# EasyEDA Pro project MSPM0G3507.eprj

# Schematic Schematic1
Board Name: Board1; Create Date: 2025-05-01
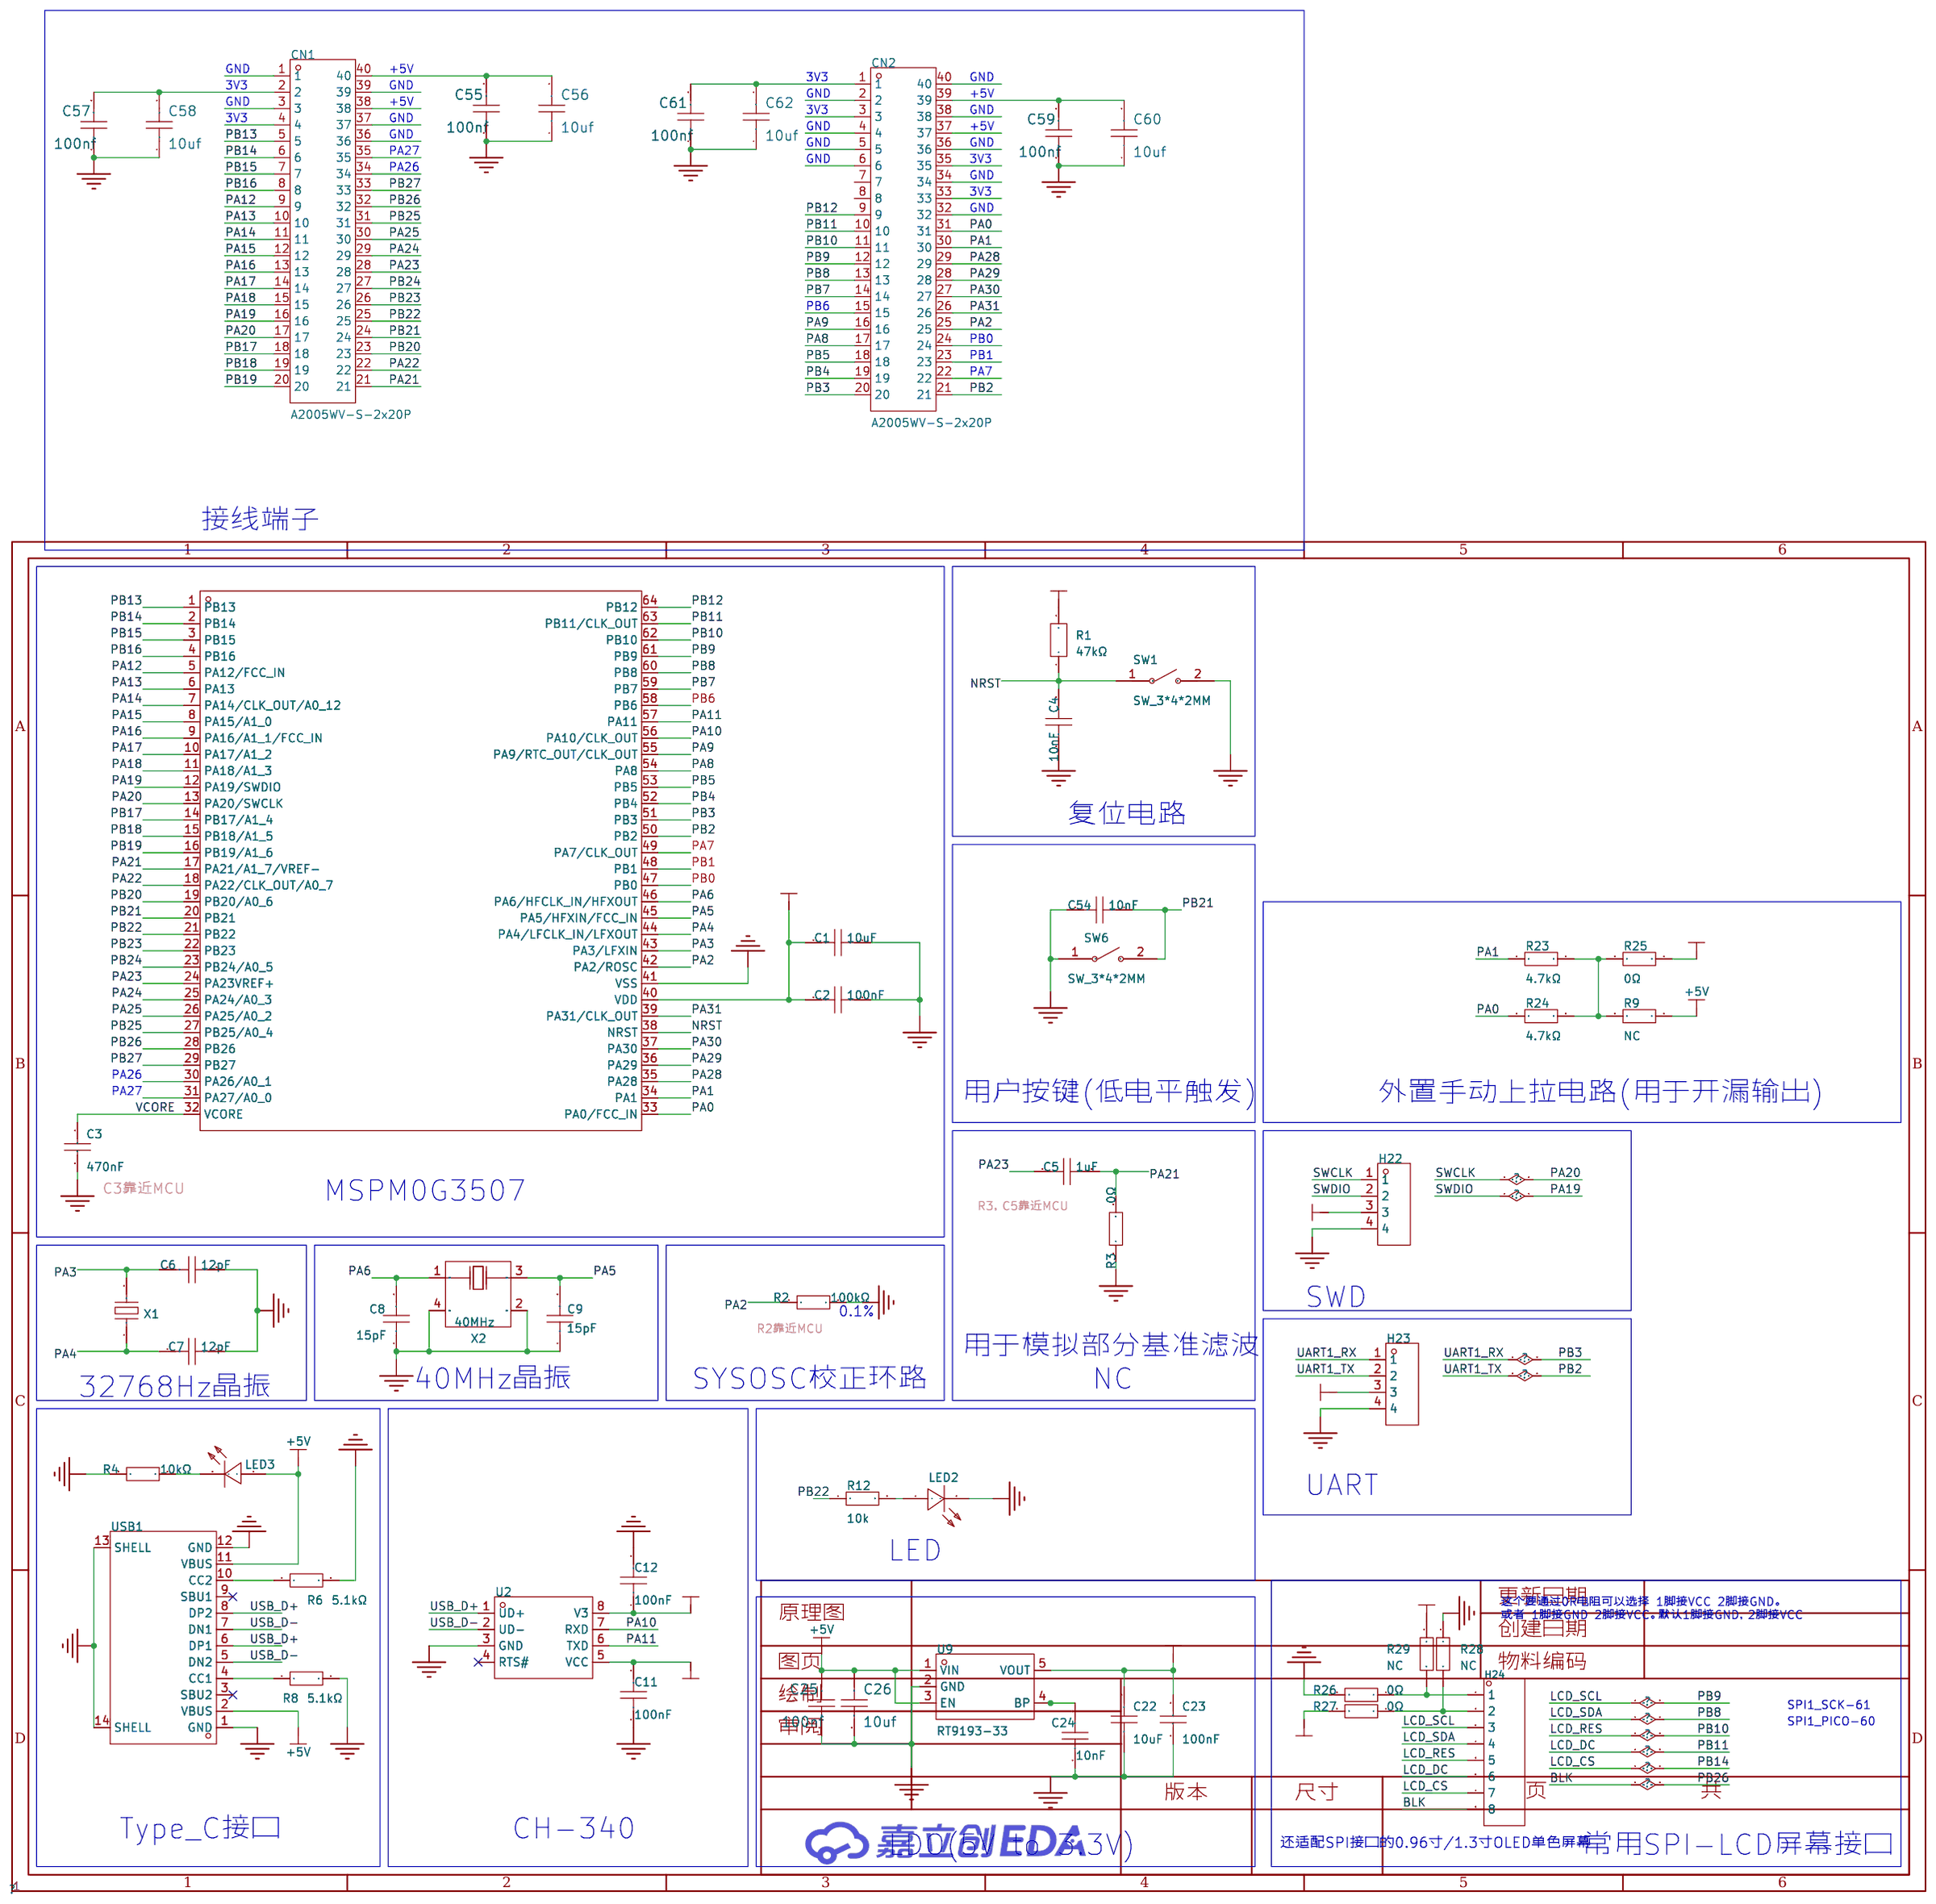
[diagram p0: schematic sheet]

## Parts
C1  10uF  [C0603]
C2  100nF  [C0603]
C3  470nF  [C0603]
C4  10nF  [C0603]
C5  1uF  [C0603]
C6  12pF  [C0603]
C7  12pF  [C0603]
C8  15pF  [C0603]
C9  15pF  [C0603]
C11  100nF  [C0603]
C12  100nF  [C0603]
C22  10uF  [C0603]
C23  100nF  [C0603]
C24  10nF  [C0603]
C25  100nf  [C0603]
C26  10uf  [C0603]
C54  10nF  [C0603]
C55  100nf  [C0603]
C56  10uf  [C0603]
C57  100nf  [C0603]
C58  10uf  [C0603]
C59  100nf  [C0603]
C60  10uf  [C0603]
C61  100nf  [C0603]
C62  10uf  [C0603]
CN1  A2005WV-S-2x20P  [HDR-TH_40P-P2.54-V-M-R2-C20-S2.54]
CN2  A2005WV-S-2x20P  [HDR-TH_40P-P2.54-V-M-R2-C20-S2.54]
H22  -  [hdr-th_4p-p2.54-v-f]
H23  -  [hdr-th_4p-p2.54-v-f]
H24  -  [HDR-TH_8P-P2.54-V-M]
LED2  NCD0805R1  [LED0603-R-RD]
LED3  NCD0805R1  [LED0603-R-RD]
R1  47kΩ  [R0603]
R2  100kΩ  [R0603]
R3  0Ω  [R0603]
R4  10kΩ  [R0603]
R6  5.1kΩ  [R0603]
R8  5.1kΩ  [R0603]
R9  NC  [R0603]
R12  10k  [R0603]
R23  4.7kΩ  [R0603]
R24  4.7kΩ  [R0603]
R25  0Ω  [R0603]
R26  0Ω  [R0603]
R27  0Ω  [R0603]
R28  NC  [R0603]
R29  NC  [R0603]
SW1  SW_3*4*2MM  [SW-SMD_L3.9-W2.9-LS4.9-L]
SW6  SW_3*4*2MM  [SW-SMD_L3.9-W2.9-LS4.9-L]
U1  MSPM0G3507SPMR  [LQFP-64_L10.0-W10.0-P0.50-LS12.0-BL]
U2  CH340N  [SOP-8_L4.9-W3.9-P1.27-LS6.0-BL]
U9  RT9193-33  [SOT-23-5_L2.9-W1.6-P0.95-LS2.8-TL]
USB1  TYPE-C 16PIN 2MD(073)  [typec16拉长]
X1  32.768kHz  [OSC-SMD_L3.2-W1.5]
X2  40MHz  [CRYSTAL-SMD_4P-L3.2-W2.5-BL]

## Library data of the parts
C1 = CL10A106MA8NRNC: 容值:10uF;精度:±20%;额定电压:25V;材质(温度系数):X5R;; LCSC Part Name: 10uF ±20% 25V; Supplier Part: C96446; Manufacturer: SAMSUNG(三星); Supplier Footprint: 0603; JLCPCB Part Class: 基础库; Datasheet: https://atta.szlcsc.com/upload/public/pdf/source/20160218/1457707763339.pdf; Supplier: LCSC; Tolerance: ±20%; Voltage Rated: 25V; Temperature Coefficient: X5R
C2 C11 C12 = CC0603KRX7R9BB104: 容值:100nF;精度:±10%;额定电压:50V;材质(温度系数):X7R;; LCSC Part Name: 100nF ±10% 50V; Supplier Part: C14663; Manufacturer: YAGEO(国巨); Supplier Footprint: 0603; JLCPCB Part Class: 基础库; Datasheet: https://atta.szlcsc.com/upload/public/pdf/source/20180910/C282072_33301C7F631E79921B82A8DAC6BCC5B3.pdf; Supplier: LCSC; Tolerance: ±10%; Voltage Rated: 50V; Temperature Coefficient: X7R
C3 = CC0805KKX7R9BB474: 容值:470nF;精度:±10%;额定电压:50V;材质(温度系数):X7R;; LCSC Part Name: 470nF ±10% 50V; Supplier Part: C106843; Manufacturer: YAGEO(国巨); Supplier Footprint: 0805; JLCPCB Part Class: 扩展库; Datasheet: https://atta.szlcsc.com/upload/public/pdf/source/20170919/C131031_1505787245477976978.pdf; Supplier: LCSC; Tolerance: ±10%; Voltage Rated: 50V; Temperature Coefficient: X7R
C4 C54 = CC0805KRX7R9BB103: 容值:10nF;精度:±10%;额定电压:50V;材质(温度系数):X7R;; LCSC Part Name: 10nF ±10% 50V; Supplier Part: C83170; Manufacturer: YAGEO(国巨); Supplier Footprint: 0805; JLCPCB Part Class: 扩展库; Datasheet: https://atta.szlcsc.com/upload/public/pdf/source/20170211/1486785656773.pdf; Supplier: LCSC; Tolerance: ±10%; Voltage Rated: 50V; Temperature Coefficient: X7R
C5 = CL10A105KB8NNNC: 容值:1uF;精度:±10%;额定电压:50V;材质(温度系数):X5R;; LCSC Part Name: 1uF ±10% 50V; Supplier Part: C15849; Manufacturer: SAMSUNG(三星); Supplier Footprint: 0603; JLCPCB Part Class: 基础库; Datasheet: https://atta.szlcsc.com/upload/public/pdf/source/20160218/1457707763339.pdf; Supplier: LCSC; Tolerance: ±10%; Voltage Rated: 50V; Temperature Coefficient: X5R
C6-C9 = CC0805FRNPO9BN220: 容值:22pF;精度:±1%;额定电压:50V;材质(温度系数):NP0;; LCSC Part Name: 22pF ±1% 50V; Supplier Part: C541515; Manufacturer: YAGEO(国巨); Supplier Footprint: 0805; JLCPCB Part Class: 扩展库; Datasheet: https://atta.szlcsc.com/upload/public/pdf/source/20200615/C541515_88B9BEA386E877B1A6E9F0AB558B8E25.pdf; Supplier: LCSC; Tolerance: ±1%; Voltage Rated: 50V; Temperature Coefficient: NP0
C22 C24 = CL10A106KP8NNNC: 容值:10uF;精度:±10%;额定电压:10V;材质(温度系数):X5R;; LCSC Part Name: 10uF ±10% 10V; Supplier Part: C19702; Manufacturer: SAMSUNG(三星); Supplier Footprint: 0603; JLCPCB Part Class: 基础库; Datasheet: https://atta.szlcsc.com/upload/public/pdf/source/20160103/1457707703378.pdf; Supplier: LCSC; Tolerance: ±10%; Voltage Rated: 10V; Temperature Coefficient: X5R
C23 = 0603B104K500NT: 容值:100nF;精度:±10%;额定电压:50V;材质(温度系数):X7R;; LCSC Part Name: 100nF ±10% 50V; Supplier Part: C30926; Manufacturer: FH(风华); Supplier Footprint: 0603; JLCPCB Part Class: 扩展库; Datasheet: https://atta.szlcsc.com/upload/public/pdf/source/20170923/C30926_1506149436298988724.pdf; Supplier: LCSC; Tolerance: ±10%; Voltage Rated: 50V; Temperature Coefficient: X7R
C25 C55 C57 C59 C61 = 100nf: link: https://item.szlcsc.com/373011.html; 3DModel: C0805_L2.0-W1.3-H1.3
C26 C56 C58 C60 C62 = 10uf: link: https://item.szlcsc.com/373011.html; 3DModel: C0805_L2.0-W1.3-H1.3
CN1 CN2 = A2005WV-S-2x20P: Supplier Part: C9900019710; Supplier Footprint: SMD-40P; JLCPCB Part Class: 扩展库; Supplier: LCSC
H22 H23 = HDR-F_2.54_1x4P: Supplier Part: C2718488; Supplier Footprint: 插件
H24 = HDR-M_2.54_1x8P: Supplier Part: NC; Supplier Footprint: 插件
LED2 LED3 = NCD0805R1: 灯头类型:-;发光颜色:红色;正向电压(VF):1.6V~2.6V;功率:65mW;正向电流:20mA;主波长:615nm~630nm;二极管配置:独立二极管;透镜颜色:无色透明透镜;色温:-;发光强度:67mcd~195mcd;发光角度:130°;载带方式:-;工作温度:-30℃~+85℃;; Supplier Part: C84256; Manufacturer: 国星光电; Supplier Footprint: 0805; JLCPCB Part Class: 基础库; Datasheet: https://atta.szlcsc.com/upload/public/pdf/source/20200820/C84256_F0A75A43B3EAD75808600A0514C76B99.pdf; Supplier: LCSC; Emitted Color: 红色; Forward Voltage (VF): 1.6V~2.6V; Power Dissipation: 65mW; Forward Current: 20mA; Dominant Wavelength: 615nm~630nm; Diode Configuration: 独立二极管; Lens Color: 无色透明透镜; Luminous Intensity: 67mcd~195mcd; Viewing Angle: 130°; Operating Temperature: -30℃~+85℃
R1 = SCR0805F47K: 电阻类型:厚膜电阻;阻值:47kΩ;精度:±1%;功率:125mW;最大工作电压:150V;; LCSC Part Name: 厚膜电阻 47kΩ ±1% 125mW; Supplier Part: C3016793; Manufacturer: VO(翔胜); Supplier Footprint: 0805; JLCPCB Part Class: 扩展库; Datasheet: https://atta.szlcsc.com/upload/public/pdf/source/20220513/247AF9639BA21CF93567DC289CCC6A22.pdf; Supplier: LCSC; Type: 厚膜电阻; Tolerance: ±1%; Power(Watts): 125mW; Overload Voltage (Max): 150V; Operating Temperature Range: -55℃~+155℃
R2 = RT0805BRD07100KL: 电阻类型:薄膜电阻;阻值:100kΩ;精度:±0.1%;功率:125mW;最大工作电压:150V;温度系数:±25ppm/℃;; LCSC Part Name: 薄膜电阻 100kΩ ±0.1% 125mW; Supplier Part: C122537; Manufacturer: YAGEO(国巨); Supplier Footprint: 0805; JLCPCB Part Class: 扩展库; Datasheet: https://atta.szlcsc.com/upload/public/pdf/source/20170721/C122537_1500619325668834091.pdf; Supplier: LCSC; Type: 薄膜电阻; Tolerance: ±0.1%; Power(Watts): 125mW; Overload Voltage (Max): 150V; Temperature Coefficient: ±25ppm/℃; Operating Temperature Range: -55℃~+155℃
R3 = 0805W8F0000T5E: 电阻类型:厚膜电阻;阻值:0Ω;精度:±1%;功率:125mW;最大工作电压:150V;温度系数:±800ppm/℃;; LCSC Part Name: 0Ω ±1% 125mW 厚膜电阻; Supplier Part: C17477; Manufacturer: UNI-ROYAL(厚声); Supplier Footprint: 0805; JLCPCB Part Class: 基础库; Datasheet: https://atta.szlcsc.com/upload/public/pdf/source/20200306/C422600_1E6D84923E4A46A82E41ADD87F860B5C.pdf; Supplier: LCSC; Type: 厚膜电阻; Tolerance: ±1%; Power(Watts): 125mW; Overload Voltage (Max): 150V; Temperature Coefficient: ±800ppm/℃; Operating Temperature Range: -55℃~+155℃
R4 = 0805W8F1000T5E: 电阻类型:厚膜电阻;阻值:100Ω;精度:±1%;功率:125mW;最大工作电压:150V;温度系数:±100ppm/℃;; LCSC Part Name: 100Ω ±1% 125mW 厚膜电阻; Supplier Part: C17408; Manufacturer: UNI-ROYAL(厚声); Supplier Footprint: 0805; JLCPCB Part Class: 基础库; Datasheet: https://atta.szlcsc.com/upload/public/pdf/source/20200306/C422600_1E6D84923E4A46A82E41ADD87F860B5C.pdf; Supplier: LCSC; Type: 厚膜电阻; Tolerance: ±1%; Power(Watts): 125mW; Overload Voltage (Max): 150V; Temperature Coefficient: ±100ppm/℃; Operating Temperature Range: -55℃~+155℃
R6 R8 = 0603WAF5101T5E: 电阻类型:厚膜电阻;阻值:5.1kΩ;精度:±1%;功率:100mW;最大工作电压:75V;温度系数:±100ppm/℃;; LCSC Part Name: 5.1kΩ ±1% 100mW 厚膜电阻; Supplier Part: C23186; Manufacturer: UNI-ROYAL(厚声); Supplier Footprint: 0603; JLCPCB Part Class: 基础库; Datasheet: https://atta.szlcsc.com/upload/public/pdf/source/20200306/C422600_1E6D84923E4A46A82E41ADD87F860B5C.pdf; Supplier: LCSC; Type: 厚膜电阻; Tolerance: ±1%; Power(Watts): 100mW; Overload Voltage (Max): 75V; Temperature Coefficient: ±100ppm/℃; Operating Temperature Range: -55℃~+155℃
R9 R25-R29 = 0603WAF0000T5E: 电阻类型:厚膜电阻;阻值:0Ω;精度:±1%;功率:100mW;最大工作电压:75V;; LCSC Part Name: 0Ω ±1% 100mW 厚膜电阻; Supplier Part: C21189; Manufacturer: UNI-ROYAL(厚声); Supplier Footprint: 0603; JLCPCB Part Class: Basic Part; Datasheet: https://atta.szlcsc.com/upload/public/pdf/source/20200306/C422600_1E6D84923E4A46A82E41ADD87F860B5C.pdf; Supplier: LCSC; Type: 厚膜电阻; Tolerance: ±1%; Power(Watts): 100mW; Overload Voltage (Max): 75V; Operating Temperature Range: -55℃~+155℃; Temperature Coefficient: ±800ppm/℃
R12 = 0603WAF4700T5E: 电阻类型:厚膜电阻;阻值:470Ω;精度:±1%;功率:100mW;最大工作电压:75V;温度系数:±100ppm/℃;; LCSC Part Name: 470Ω ±1% 100mW 厚膜电阻; Supplier Part: C23179; Manufacturer: UNI-ROYAL(厚声); Supplier Footprint: 0603; JLCPCB Part Class: 基础库; Datasheet: https://atta.szlcsc.com/upload/public/pdf/source/20200306/C422600_1E6D84923E4A46A82E41ADD87F860B5C.pdf; Supplier: LCSC; Type: 厚膜电阻; Tolerance: ±1%; Power(Watts): 100mW; Overload Voltage (Max): 75V; Temperature Coefficient: ±100ppm/℃; Operating Temperature Range: -55℃~+155℃
R23 R24 = 0603WAF4701T5E: 电阻类型:厚膜电阻;阻值:4.7kΩ;精度:±1%;功率:100mW;最大工作电压:75V;温度系数:±100ppm/℃;; LCSC Part Name: 4.7kΩ ±1% 100mW 厚膜电阻; Supplier Part: C23162; Manufacturer: UNI-ROYAL(厚声); Supplier Footprint: 0603; JLCPCB Part Class: Basic Part; Datasheet: https://atta.szlcsc.com/upload/public/pdf/source/20200306/C422600_1E6D84923E4A46A82E41ADD87F860B5C.pdf; Supplier: LCSC; Type: 厚膜电阻; Tolerance: ±1%; Power(Watts): 100mW; Overload Voltage (Max): 75V; Temperature Coefficient: ±100ppm/℃; Operating Temperature Range: -55℃~+155℃
SW1 SW6 = SW_3*4*2MM: Supplier Part: C9900016193; Supplier Footprint: SW_3*4*2; JLCPCB Part Class: 扩展库; Supplier: LCSC
U1 = MSPM0G3507SPMR_C22389960: Supplier Part: C22389960; Manufacturer: TI(德州仪器); Supplier Footprint: LQFP-64(10x10); JLCPCB Part Class: 扩展库; Datasheet: https://atta.szlcsc.com/upload/public/pdf/source/20240621/D7254EAE03B6DB9B67DC0EA221DC405D.pdf; Supplier: LCSC
U2 = CH340N: LCSC Part Name: USB转串口芯片 CH340; Supplier Part: C2977777; Manufacturer: WCH(南京沁恒); Supplier Footprint: SOP-8; JLCPCB Part Class: 扩展库; Datasheet: https://atta.szlcsc.com/upload/public/pdf/source/20230530/6E401E9554E9F5311886CC8B3F89B62E.pdf; Supplier: LCSC
U9 = RT9193-33_C9900006434: Supplier Part: C9900006434; Supplier Footprint: LC-SOT-23-5; JLCPCB Part Class: 扩展库; Supplier: LCSC
USB1 = TYPE-C 16PIN 2MD(073): 连接器类型:Type-C;标准:-;公母:母;端口数量:1;触点数量:16P;安装方式:卧贴;额定电流 - 电源:5A;工作温度范围:-25℃~+85℃;; LCSC Part Name: Type-C 母 卧贴; Supplier Part: C2765186; Manufacturer: SHOU HAN(首韩); Supplier Footprint: SMD; JLCPCB Part Class: 扩展库; Datasheet: https://atta.szlcsc.com/upload/public/pdf/source/20211123/39B17C16241EAC15C5E277BDA434118E.pdf; Supplier: LCSC; Connector Type: Type-C; Gender: 母; Number of Ports: 1; Number of Contacts: 16P; Mounting Style: 卧贴; Current Rating - Power (Max): 5A; Operating Temperature Range: -25℃~+85℃
X1 = X321532768KGD2SI: 晶振类型:贴片晶振;频率:32.768kHz;常温频差:±20ppm;外接负载电容:12.5pF;频率稳定度(全温):-;; LCSC Part Name: 32.768kHz ±20ppm 12.5pF; Supplier Part: C620155; Manufacturer: YXC(扬兴晶振); Supplier Footprint: SMD3215-2P; JLCPCB Part Class: 扩展库; Datasheet: https://atta.szlcsc.com/upload/public/pdf/source/20240329/3A7650FD985DD0DE85694D3785AB4916.pdf; Supplier: LCSC; Crystal Type: 贴片晶振; Normal temperature Frequency Tolerance: ±20ppm; External load capacitor: 12.5pF; Operating Temperature: -40℃~+85℃
X2 = S3240000121040: 晶振类型:贴片晶振;频率:40MHz;常温频差:±10ppm;外接负载电容:12pF;; LCSC Part Name: 40MHz ±10ppm 12pF; Supplier Part: C426989; Manufacturer: JGHC(晶光华); Supplier Footprint: SMD3225-4P; JLCPCB Part Class: 扩展库; Datasheet: https://atta.szlcsc.com/upload/public/pdf/source/20191012/C431172_99BCDFC5E39E114929AE7F9C9DED2B9F.pdf; Supplier: LCSC; Crystal Type: 贴片晶振; Normal temperature Frequency Tolerance: ±10ppm; External load capacitor: 12pF; Equivalent Series Resistance (ESR): 40Ω; Operating Temperature: -40℃~+85℃

## Nets
3V3: C1.2 C2.2 C11.2 C12.1 C22.2 C23.2 C57.2 C58.2 C61.2 C62.2 CN1.2 CN1.4 CN2.1 CN2.3 CN2.33 CN2.35 H22.3 H23.3 R1.2 R25.1 R27.2 R29.1 U1.40(VDD) U2.5(VCC) U2.8(V3) U9.5(VOUT)
+5V: C25.2 C26.2 C55.2 C56.2 C59.2 C60.2 CN1.38 CN1.40 CN2.37 CN2.39 LED3.1(+) R9.1 U9.1(VIN) U9.3(EN) USB1.2(VBUS) USB1.11(VBUS)
GND: C1.1 C2.1 C3.1 C4.1 C6.2 C7.2 C8.1 C9.1 C11.1 C12.2 C22.1 C23.1 C24.1 C25.1 C26.1 C54.2 C55.1 C56.1 C57.1 C58.1 C59.1 C60.1 C61.1 C62.1 CN1.1 CN1.3 CN1.36 CN1.37 CN1.39 CN2.2 CN2.4 CN2.5 CN2.6 CN2.32 CN2.34 CN2.36 CN2.38 CN2.40 H22.4 H23.4 LED2.2(-) R2.2 R3.1 R4.1 R6.2 R8.2 R26.2 R28.1 SW1.2 SW6.1 U1.41(VSS) U2.3(GND) U9.2(GND) USB1.1(GND) USB1.12(GND) USB1.13(SHELL) USB1.14(SHELL) X2.2(GND) X2.4(OSC1)
BLK: CN1.32 H24.8 U1.28(PB26)
LCD_CS: CN1.6 H24.7 U1.2(PB14)
LCD_DC: CN2.10 H24.6 U1.63(PB11/CLK_OUT)
LCD_RES: CN2.11 H24.5 U1.62(PB10)
LCD_SCL: CN2.12 H24.3 U1.61(PB9)
LCD_SDA: CN2.13 H24.4 U1.60(PB8)
NRST: C4.2 R1.1 SW1.1 U1.38(NRST)
PA0: CN2.31 R24.1 U1.33(PA0/FCC_IN)
PA1: CN2.30 R23.1 U1.34(PA1)
PA2: CN2.25 R2.1 U1.42(PA2/ROSC)
PA3: C6.1 U1.43(PA3/LFXIN) X1.2
PA4: C7.1 U1.44(PA4/LFCLK_IN/LFXOUT) X1.1
PA5: C9.2 U1.45(PA5/HFXIN/FCC_IN) X2.3(OSC2)
PA6: C8.2 U1.46(PA6/HFCLK_IN/HFXOUT) X2.1(GND)
PA7: CN2.22 U1.49(PA7/CLK_OUT)
PA8: CN2.17 U1.54(PA8)
PA9: CN2.16 U1.55(PA9/RTC_OUT/CLK_OUT)
PA10: U1.56(PA10/CLK_OUT) U2.7(RXD)
PA11: U1.57(PA11) U2.6(TXD)
PA12: CN1.9 U1.5(PA12/FCC_IN)
PA13: CN1.10 U1.6(PA13)
PA14: CN1.11 U1.7(PA14/CLK_OUT/A0_12)
PA15: CN1.12 U1.8(PA15/A1_0)
PA16: CN1.13 U1.9(PA16/A1_1/FCC_IN)
PA17: CN1.14 U1.10(PA17/A1_2)
PA18: CN1.15 U1.11(PA18/A1_3)
PA19: CN1.16 H22.2 U1.12(PA19/SWDIO)
PA20: CN1.17 H22.1 U1.13(PA20/SWCLK)
PA21: C5.2 CN1.21 R3.2 U1.17(PA21/A1_7/VREF-)
PA22: CN1.22 U1.18(PA22/CLK_OUT/A0_7)
PA23: C5.1 CN1.28 U1.24(PA23VREF+)
PA24: CN1.29 U1.25(PA24/A0_3)
PA25: CN1.30 U1.26(PA25/A0_2)
PA26: CN1.34 U1.30(PA26/A0_1)
PA27: CN1.35 U1.31(PA27/A0_0)
PA28: CN2.29 U1.35(PA28)
PA29: CN2.28 U1.36(PA29)
PA30: CN2.27 U1.37(PA30)
PA31: CN2.26 U1.39(PA31/CLK_OUT)
PB0: CN2.24 U1.47(PB0)
PB1: CN2.23 U1.48(PB1)
PB2: CN2.21 H23.2 U1.50(PB2)
PB3: CN2.20 H23.1 U1.51(PB3)
PB4: CN2.19 U1.52(PB4)
PB5: CN2.18 U1.53(PB5)
PB6: CN2.15 U1.58(PB6)
PB7: CN2.14 U1.59(PB7)
PB12: CN2.9 U1.64(PB12)
PB13: CN1.5 U1.1(PB13)
PB15: CN1.7 U1.3(PB15)
PB16: CN1.8 U1.4(PB16)
PB17: CN1.18 U1.14(PB17/A1_4)
PB18: CN1.19 U1.15(PB18/A1_5)
PB19: CN1.20 U1.16(PB19/A1_6)
PB20: CN1.23 U1.19(PB20/A0_6)
PB21: C54.1 CN1.24 SW6.2 U1.20(PB21)
PB22: CN1.25 R12.1 U1.21(PB22)
PB23: CN1.26 U1.22(PB23)
PB24: CN1.27 U1.23(PB24/A0_5)
PB25: CN1.31 U1.27(PB25/A0_4)
PB27: CN1.33 U1.29(PB27)
USB_D+: U2.1(UD+) USB1.6(DP1) USB1.8(DP2)
USB_D-: U2.2(UD-) USB1.5(DN2) USB1.7(DN1)
VCORE: C3.2 U1.32(VCORE)
$1N8212: R6.1 USB1.10(CC2)
$1N8214: R8.1 USB1.4(CC1)
$1N9211: LED3.2(-) R4.2
$1N21299: C24.2 U9.4(BP)
$1N23399: R9.2 R23.2 R24.2 R25.2
$1N23715: LED2.1(+) R12.2
Net-(H24-1): H24.1 R26.1 R29.2
Net-(H24-2): H24.2 R27.1 R28.2

Not connected (* = marked no-connect by the designer): CN2 7 8; U2 4(RTS#)*; USB1 3(SBU2)* 9(SBU1)*

## Notes on the sheet
- 接线端子
- 复位电路
- 用户按键(低电平触发)
- 外置手动上拉电路(用于开漏输出)
- C3靠近MCU
- MSPM0G3507
- R3，C5靠近MCU
- SWD
- 0.1%
- R2靠近MCU
- 用于模拟部分基准滤波
- 32768Hz晶振
- 40MHz晶振
- SYSOSC校正环路
- NC
- UART
- LED
- 这个要通过0R电阻可以选择 1脚接VCC 2脚接GND。
  或者 1脚接GND 2脚接VCC。默认1脚接GND，2脚接VCC
- SPI1_SCK-61
- SPI1_PICO-60
- Type_C接口
- CH-340
- 还适配SPI接口的0.96寸/1.3寸OLED单色屏幕
- LDO(5V to 3.3V)
- 常用SPI-LCD屏幕接口

# Board PCB1
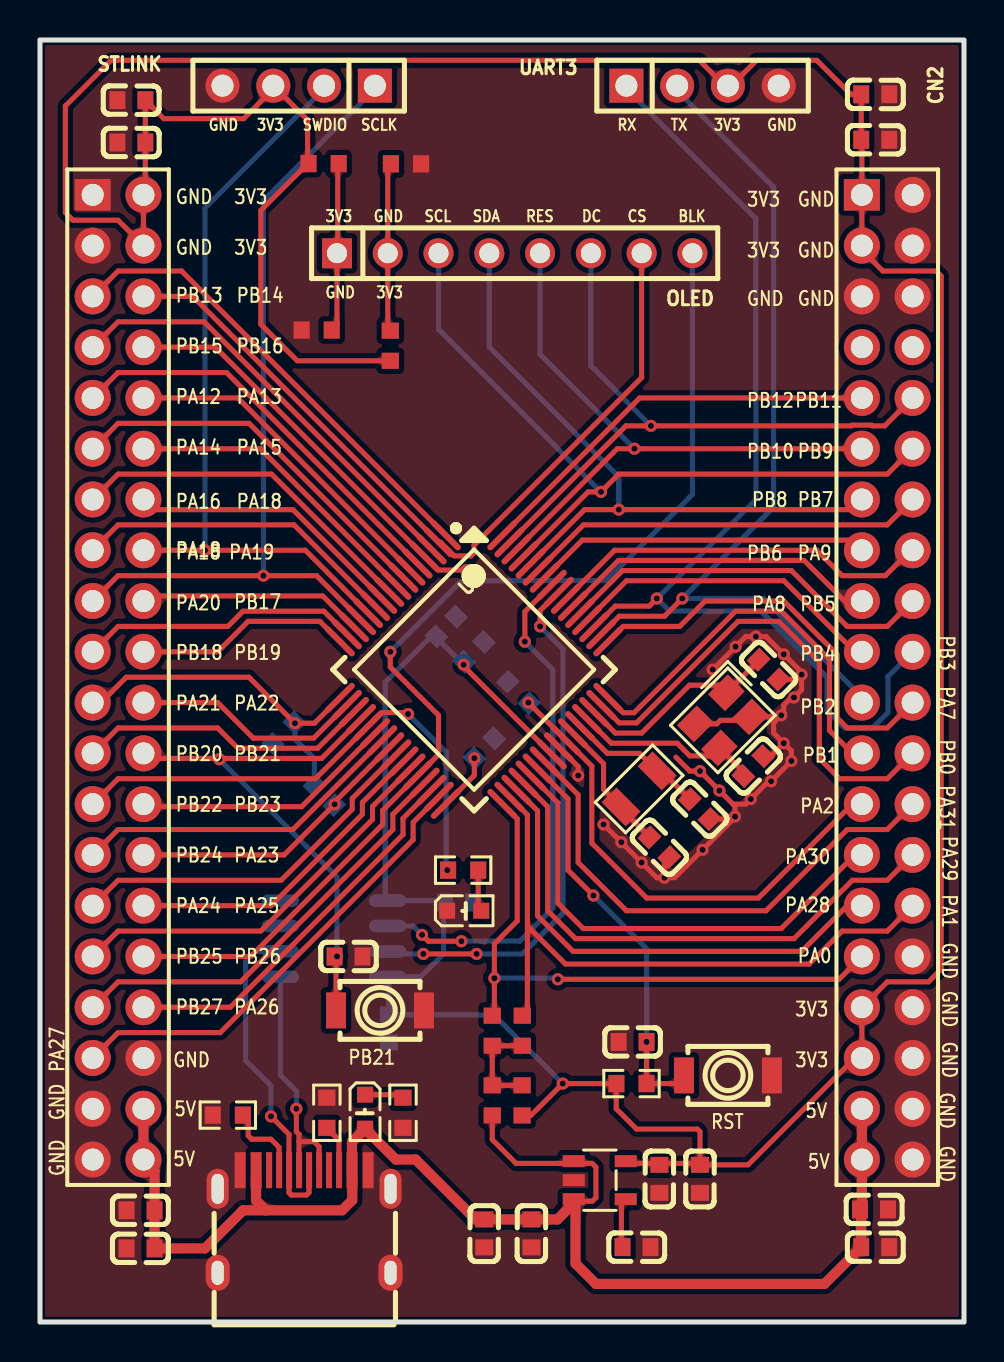
[diagram p1: board, top side]
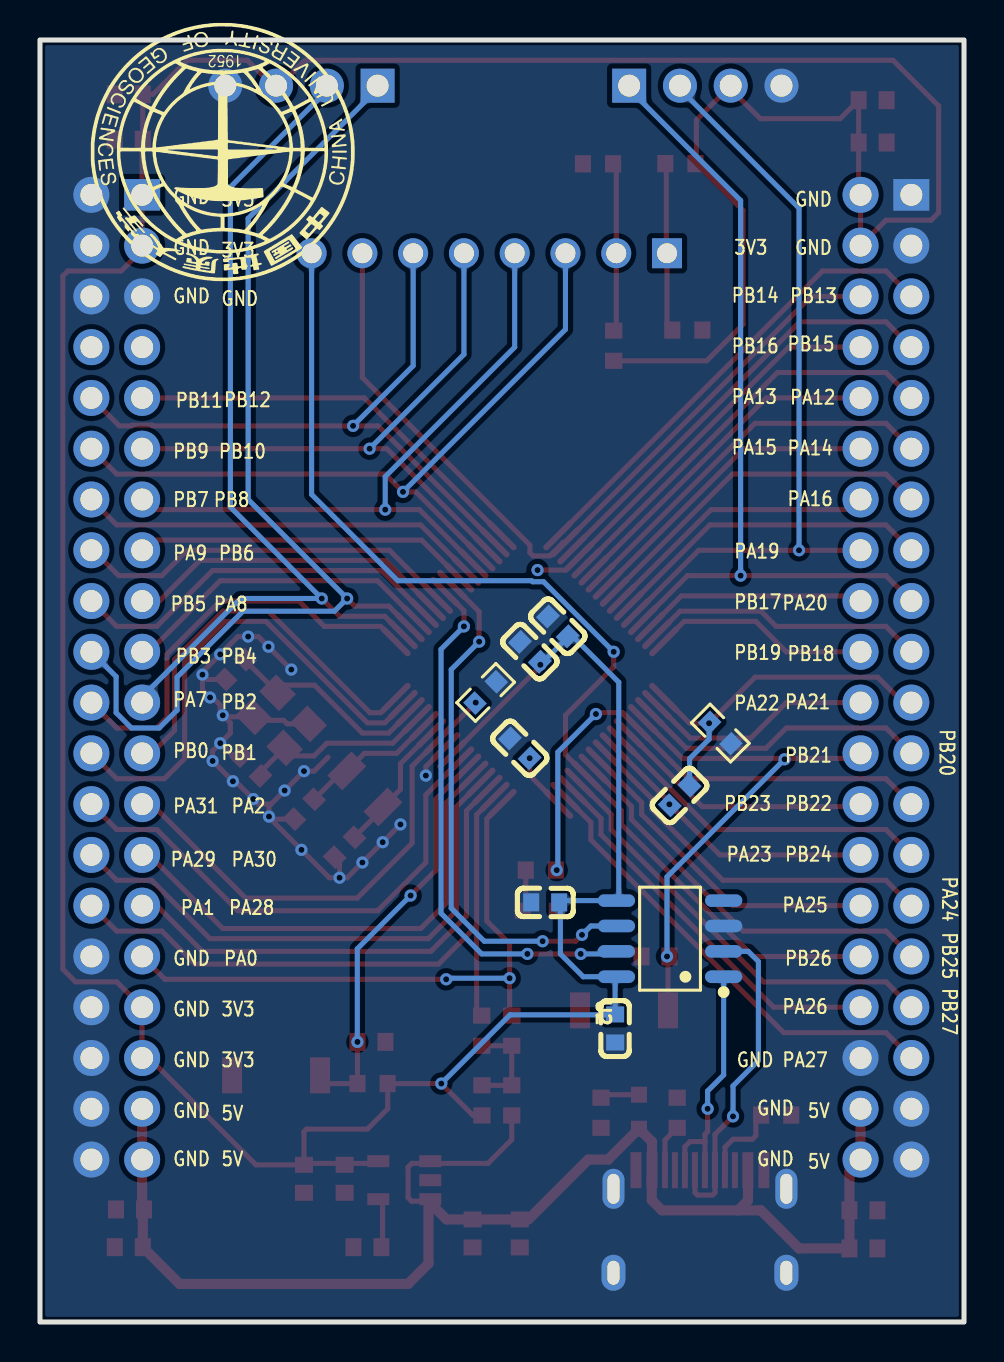
[diagram p2: board, bottom side, seen from below]

Outline 46.23 x 64.13 mm; copper layers: Top Layer, Bottom Layer. Coordinates in mm from the lower left corner of the outline.
Outline path: rectangle 0,64.13 46.23,0
Stack: Top Layer 0.035mm / Dielectric1 1.51mm FR4 er 4.5 / Bottom Layer 0.035mm

## Design rules (mm)
template: 自定义配置
spacing copperThickness1oz (default): track to track 0.102, other pairs 0.152 to 0.3
spacing copperThickness2oz: track to track 0.203, other pairs 0.152 to 0.3
track width copperThickness1oz (default): min 0.127, default 0.254, max 2.54
track width copperThickness2oz: min 0.203, default 0.254, max 2.54
differential pair differentialPair (default): width min 0.127, default 0.254, max 2.54; gap min 0.152, default 0.152
via viaSize (default): diameter min 0.5, default 0.61, max 10; hole min 0.3, default 0.305, max 6.3

## Placement (name value [footprint] x y rotation side)
C1  10uF  [C0603]  21.72 33.53 225 bottom
C2  100nF  [C0603]  20.32 34.8 225 bottom
C3  470nF  [C0603]  22.22 28.7 225 bottom
C4  10nF  [C0603]  29.65 14.01 0 top
C5  1uF  [C0603]  14.22 26.35 135 bottom
C6  12pF  [C0603]  30.99 23.75 315 top
C7  12pF  [C0603]  33.01 25.65 315 top
C8  15pF  [C0603]  36.45 32.64 135 top
C9  15pF  [C0603]  35.69 27.81 225 top
C11  100nF  [C0603]  17.45 14.69 90 bottom
C12  100nF  [C0603]  20.95 20.99 0 bottom
C22  10uF  [C0603]  33.02 7.16 90 top
C23  100nF  [C0603]  30.99 7.16 90 top
C24  10nF  [C0603]  29.84 3.75 180 top
C25  100nf  [C0603]  22.22 4.43 90 top
C26  10uf  [C0603]  24.59 4.43 90 top
C54  10nF  [C0603]  15.44 18.29 0 top
C55  100nf  [C0603]  5.03 5.59 0 top
C56  10uf  [C0603]  5.03 3.68 0 top
C57  100nf  [C0603]  4.57 61.12 0 top
C58  10uf  [C0603]  4.57 59 0 top
C59  100nf  [C0603]  41.72 5.63 180 top
C60  10uf  [C0603]  41.78 3.75 180 top
C61  100nf  [C0603]  41.79 61.42 180 top
C62  10uf  [C0603]  41.79 59.15 180 top
CN1  A2005WV-S-2x20P  [HDR-TH_40P-P2.54-V-M-R2-C20-S2.54]  3.91 32.26 270 top
CN2  A2005WV-S-2x20P  [HDR-TH_40P-P2.54-V-M-R2-C20-S2.54]  42.39 32.26 270 top
LED2  NCD0805R1  [LED0603-R-RD]  21.22 20.57 0 top
LED3  NCD0805R1  [LED0603-R-RD]  16.26 10.52 270 top
OLED  -  [HDR-TH_8P-P2.54-V-M]  23.75 53.47 0 top
R1  47kΩ  [R0603]  29.59 11.93 180 top
R2  100kΩ  [R0603]  23.93 31.5 135 bottom
R3  0Ω  [R0603]  12.19 29.46 45 bottom
R4  10kΩ  [R0603]  18.16 10.47 90 top
R6  5.1kΩ  [R0603]  14.35 10.47 90 top
R8  5.1kΩ  [R0603]  9.4 10.35 180 top
R9  NC  [R0603]  22.63 11.09 90 top
R12  10k  [R0603]  21.17 22.61 0 top
R23  4.7kΩ  [R0603]  24.13 14.57 270 top
R24  4.7kΩ  [R0603]  22.63 14.57 270 top
R25  0Ω  [R0603]  24.12 11.09 90 top
R26  0Ω  [R0603]  13.84 49.62 180 top
R27  0Ω  [R0603]  17.53 48.84 270 top
R28  NC  [R0603]  18.31 57.94 180 top
R29  NC  [R0603]  14.19 57.95 0 top
STLINK  -  [hdr-th_4p-p2.54-v-f]  12.94 61.85 180 top
SW1  SW_3*4*2MM  [SW-SMD_L3.9-W2.9-LS4.9-L]  34.42 12.34 0 top
SW6  SW_3*4*2MM  [SW-SMD_L3.9-W2.9-LS4.9-L]  17.01 15.59 180 top
U1  MSPM0G3507SPMR  [LQFP-64_L10.0-W10.0-P0.50-LS12.0-BL]  21.72 32.64 225 top
U2  CH340N  [SOP-8_L4.9-W3.9-P1.27-LS6.0-BL]  14.71 19.18 90 bottom
U9  RT9193-33  [SOT-23-5_L2.9-W1.6-P0.95-LS2.8-TL]  28 7.1 0 top
UART3  -  [hdr-th_4p-p2.54-v-f]  33.15 61.85 0 top
USB1  TYPE-C 16PIN 2MD(073)  [typec16拉长]  13.21 4.86 0 top
X1  32.768kHz  [OSC-SMD_L3.2-W1.5]  29.97 26.67 225 top
X2  40MHz  [CRYSTAL-SMD_4P-L3.2-W2.5-BL]  34.16 30.1 225 top

## Footprints (pads in the part's own frame, mm; a bottom-side part is the same pattern mirrored in y, then rotated)
C0603
  rect 0.8x0.9 smd: 1(-0.7,0) 2(0.7,0)
CRYSTAL-SMD_4P-L3.2-W2.5-BL
  rect 1.4x1.2 smd: 1(-1.1,-0.85) 2(1.1,-0.85) 3(1.1,0.85) 4(-1.1,0.85)
hdr-th_4p-p2.54-v-f
  rect 1.7x1.7 hole 1.1: 1(-3.81,0)
  round 1.7 hole 1.1: 2(-1.27,0) 3(1.27,0) 4(3.81,0)
HDR-TH_8P-P2.54-V-M
  rect 1.5x1.5 hole 1: 1(-8.89,0)
  round 1.5 hole 1: 2(-6.35,0) 3(-3.81,0) 4(-1.27,0) 5(1.27,0) 6(3.81,0) 7(6.35,0) 8(8.89,0)
HDR-TH_40P-P2.54-V-M-R2-C20-S2.54
  rect 1.575x1.8 hole 1.1: 1(-24.13,-1.27)
  round 1.8 hole 1.1: 2(-24.13,1.27) 3(-21.59,-1.27) 4(-21.59,1.27) 5(-19.05,-1.27) 6(-19.05,1.27) 7(-16.51,-1.27) 8(-16.51,1.27) 9(-13.97,-1.27) 10(-13.97,1.27) 11(-11.43,-1.27) 12(-11.43,1.27) 13(-8.89,-1.27) 14(-8.89,1.27) 15(-6.35,-1.27) 16(-6.35,1.27) 17(-3.81,-1.27) 18(-3.81,1.27) 19(-1.27,-1.27) 20(-1.27,1.27) 21(1.27,-1.27) 22(1.27,1.27) 23(3.81,-1.27) 24(3.81,1.27) 25(6.35,-1.27) 26(6.35,1.27) 27(8.89,-1.27) 28(8.89,1.27) 29(11.43,-1.27) 30(11.43,1.27) 31(13.97,-1.27) 32(13.97,1.27) 33(16.51,-1.27) 34(16.51,1.27) 35(19.05,-1.27) 36(19.05,1.27) 37(21.59,-1.27) 38(21.59,1.27) 39(24.13,-1.27) 40(24.13,1.27)
LED0603-R-RD
  rect 0.8x0.8 smd: 1(0.851,0) 2(-0.851,0)
LQFP-64_L10.0-W10.0-P0.50-LS12.0-BL
  oval 0.3x2 smd: 1(-3.75,-5.75) 2(-3.25,-5.75) 3(-2.75,-5.75) 4(-2.25,-5.75) 5(-1.75,-5.75) 6(-1.25,-5.75) 7(-0.75,-5.75) 8(-0.25,-5.75) 9(0.25,-5.75) 10(0.75,-5.75) 11(1.25,-5.75) 12(1.75,-5.75) 13(2.25,-5.75) 14(2.75,-5.75) 15(3.25,-5.75) 16(3.75,-5.75) 33(3.75,5.75) 34(3.25,5.75) 35(2.75,5.75) 36(2.25,5.75) 37(1.75,5.75) 38(1.25,5.75) 39(0.75,5.75) 40(0.25,5.75) 41(-0.25,5.75) 42(-0.75,5.75) 43(-1.25,5.75) 44(-1.75,5.75) 45(-2.25,5.75) 46(-2.75,5.75) 47(-3.25,5.75) 48(-3.75,5.75)
  oval 2x0.3 smd: 17(5.75,-3.75) 18(5.75,-3.25) 19(5.75,-2.75) 20(5.75,-2.25) 21(5.75,-1.75) 22(5.75,-1.25) 23(5.75,-0.75) 24(5.75,-0.25) 25(5.75,0.25) 26(5.75,0.75) 27(5.75,1.25) 28(5.75,1.75) 29(5.75,2.25) 30(5.75,2.75) 31(5.75,3.25) 32(5.75,3.75) 49(-5.75,3.75) 50(-5.75,3.25) 51(-5.75,2.75) 52(-5.75,2.25) 53(-5.75,1.75) 54(-5.75,1.25) 55(-5.75,0.75) 56(-5.75,0.25) 57(-5.75,-0.25) 58(-5.75,-0.75) 59(-5.75,-1.25) 60(-5.75,-1.75) 61(-5.75,-2.25) 62(-5.75,-2.75) 63(-5.75,-3.25) 64(-5.75,-3.75)
OSC-SMD_L3.2-W1.5
  rect 1.05x1.7 smd: 1(-1.275,0) 2(1.275,0)
R0603
  rect 0.806x0.864 smd: 1(-0.753,0) 2(0.753,0)
SOP-8_L4.9-W3.9-P1.27-LS6.0-BL
  oval 0.63x1.865 smd: 1(-1.905,-2.683) 2(-0.635,-2.683) 3(0.635,-2.683) 4(1.905,-2.683) 5(1.905,2.683) 6(0.635,2.683) 7(-0.635,2.683) 8(-1.905,2.683)
SOT-23-5_L2.9-W1.6-P0.95-LS2.8-TL
  rect 1.1x0.6 smd: 1(-1.3,0.95) 2(-1.3,0) 3(-1.3,-0.95) 4(1.3,-0.95) 5(1.3,0.95)
SW-SMD_L3.9-W2.9-LS4.9-L
  rect 1x1.8 smd: 1(-2.2,0) 2(2.2,0)
typec16拉长
  rect 0.55x1.8 smd: 1(-3.195,2.736) 2(-2.395,2.736) 11(2.405,2.736) 12(3.205,2.736)
  rect 0.3x1.8 smd: 3(-1.745,2.736) 4(-1.245,2.736) 5(-0.745,2.736) 6(-0.245,2.736) 7(0.255,2.736) 8(0.755,2.736) 9(1.255,2.736) 10(1.755,2.736)
  oval 1.1x2 hole 0.6x1.5: 13(-4.32,1.805) 14(4.33,1.805)
  oval 1.2x1.8 hole 0.6x1.2: 13(-4.32,-2.395) 14(4.33,-2.395)

## Nets
As in the schematic, except:
3V3: C1.2 C2.2 C11.2 C12.1 C22.2 C23.2 C57.2 C58.2 C61.2 C62.2 CN1.2 CN1.4 CN2.1 CN2.3 CN2.33 CN2.35 R1.2 R25.1 R27.2 R29.1 STLINK.3 U1.40 U2.5 U2.8 U9.5 UART3.3
GND: C1.1 C2.1 C3.1 C4.1 C6.2 C7.2 C8.1 C9.1 C11.1 C12.2 C22.1 C23.1 C24.1 C25.1 C26.1 C54.2 C55.1 C56.1 C57.1 C58.1 C59.1 C60.1 C61.1 C62.1 CN1.1 CN1.3 CN1.36 CN1.37 CN1.39 CN2.2 CN2.4 CN2.5 CN2.6 CN2.32 CN2.34 CN2.36 CN2.38 CN2.40 LED2.2 R2.2 R3.1 R4.1 R6.2 R8.2 R26.2 R28.1 STLINK.4 SW1.2 SW6.1 U1.41 U2.3 U9.2 UART3.4 USB1.1 USB1.12 USB1.13 USB1.14 X2.2 X2.4
BLK: CN1.32 OLED.8 U1.28
LCD_CS: CN1.6 OLED.7 U1.2
LCD_DC: CN2.10 OLED.6 U1.63
LCD_RES: CN2.11 OLED.5 U1.62
LCD_SCL: CN2.12 OLED.3 U1.61
LCD_SDA: CN2.13 OLED.4 U1.60
PA19: CN1.16 STLINK.2 U1.12
PA20: CN1.17 STLINK.1 U1.13
PB2: CN2.21 U1.50 UART3.2
PB3: CN2.20 U1.51 UART3.1
$1N24179: OLED.1 R26.1 R29.2
$1N24180: OLED.2 R27.1 R28.2

Pads without a net: CN2 7 8; U2 4; USB1 3 9

## Via types
v1: diameter 0.61, hole 0.305, Top Layer to Bottom Layer, 52 vias

## Routing (per net, layer and track width the routed paths; a pad name or vN(x,y) marks a point on that pad's centre or on a via; arc(x,y) is an arc through that point)
3V3: length 213.5
  Top Layer w0.254: 29.09,7.94 32.95,7.94 C22.2 ; C22.2 35.42,7.86 40.77,13.21 CN2.35 CN2.33 42.39,17.02 44.45,17.02 45.09,17.65 45.09,52.32 44.83,52.58 42.16,52.58 41.12,53.62 CN2.3 CN2.1 41.12,59.11 C62.2 C61.2 40.57,61.42 38.86,63.12 35.85,63.12 34.42,61.68 32.98,63.12 3.56,63.12 1.27,60.83 1.27,55.5 1.65,55.12 3.91,55.12 CN1.4 CN1.2 5.27,56.48 C58.2 C57.2 6.2,60.2 10.19,60.2 11.67,61.68 STLINK.3 13.39,60.13 13.39,57.95 11.05,55.61 11.05,49.91 12.87,48.09 R27.2 ; C22.2 33.02,9.53 32.89,9.65 29.84,9.65 28.83,10.67 28.83,11.92 R1.2 v1(26.15,11.93) 24.56,10.33 R25.1 ; U1.40 21.2,32.81 v1(21.2,32.88)
  Bottom Layer w0.254: 17.45,15.37 22.71,15.37 v1(26.15,11.93) ; C11.2 17.45,17.21 U2.8 19.05,17.27 20.19,18.41 20.19,20.93 C12.1 20.17,21.08 U2.5 17.27,21.08 17.27,32 19.57,34.3 C2.2 ; v1(21.2,32.88) 19.8,34.28
+5V: length 71.8
  Top Layer w0.254: 26.79,6.03 26.8,6.04 27.63,6.04 27.81,6.22 27.81,7.75 27.62,7.94 23.81,7.94 22.63,9.12 R9.1
  Top Layer w0.508: 10.81,7.23 10.81,6.08 11.3,5.59 ; 11.3,5.59 10.16,5.59 8.25,3.68 C56.2 C55.2 5.73,7.57 CN1.40 CN1.38 ; 11.3,5.59 15.11,5.59 15.62,6.1 15.62,7.22 15.61,7.23 15.61,9.02 LED3.1 17.8,8.13 18.8,8.13 21.79,5.13 C25.2 C26.2 25.89,5.13 26.79,6.03 26.79,2.93 27.81,1.91 39.24,1.91 C60.2 41.08,5.57 C59.2 41.12,5.73 CN2.39 CN2.37
GND: length 39.6
  Top Layer w0.254: v1(33.99,26.59) 34.67,25.91 ; 34.67,25.91 34.77,25.81 v1(34.77,25.29) ; 34.67,25.91 35.31,25.91 v1(35.56,26.16) 36.45,27.05 v1(36.58,27.05) v1(37.59,28.07) 37.59,28.57 v1(37.21,28.96) ; v1(33.66,32.64) v1(34.8,33.78) 35.31,34.29 v1(35.81,34.29) 36.32,34.29 v1(37.21,33.4) 38.1,32.51 v1(38.1,32.38) ; v1(38.1,32.38) 37.86,32.14 36.94,32.14 ; v1(38.1,32.38) 38.1,31.62 v1(37.72,31.24) 37.59,31.24 37.21,30.86 37.21,30.48 v1(37.08,30.35) 37.01,30.28 ; v1(37.21,28.96) 36.56,28.31 36.18,28.31 ; v1(37.21,28.96) 36.7,29.46 36.7,29.97 37.01,30.28 ; 32.78,29.92 33.86,29.92 34.04,30.1 35.36,30.1 35.54,30.28 37.01,30.28 ; 25.96,28.75 26.92,27.79 26.92,27.56 ; 31.81,28.26 32.51,27.56 v1(33.02,27.56) 33.99,26.59 ; v1(34.77,25.29) 34.77,25.25 v1(33.15,23.62) 31.75,22.22 v1(31.24,22.22) ; v1(34.77,25.29) 34.64,25.16 C7.2 ; v1(28.19,24.89) v1(29.08,24) v1(30.1,22.99) 30.86,22.22 v1(31.24,22.22) ; C6.2 31.24,23.01 v1(31.24,22.22)
  vias: v1(26.92,27.34)
BLK: length 55.9
  Top Layer w0.254: CN1.32 10.54,18.29 17.14,24.89 17.14,25.59 U1.28 19.94,28.39 19.94,30.35 17.53,32.77 v1(17.53,33.53)
  Bottom Layer w0.254: v1(17.53,33.53) 21.03,37.03 21.58,37.03 21.63,37.08 28.32,37.08 32.64,41.4 OLED.8
LCD_CS: length 40.4
  Top Layer w0.254: CN1.6 7.64,51.31 U1.2 20.05,39 20.73,38.33 21.56,38.33 21.72,38.48 21.72,38.86 30.1,47.24 OLED.7
LCD_DC: length 33.1
  Top Layer w0.254: CN2.10 42.26,44.83 41.64,44.83 41.61,44.87 40.63,44.87 40.59,44.83 v1(30.56,44.83) 29.31,44.83 U1.63
  Bottom Layer w0.254: v1(30.56,44.83) 27.56,47.84 OLED.6
LCD_RES: length 31.1
  Top Layer w0.254: CN2.11 v1(29.74,43.69) 28.88,43.69 U1.62
  Bottom Layer w0.254: v1(29.74,43.69) 25.02,48.41 OLED.5
LCD_SCL: length 37
  Top Layer w0.254: U1.61 27.42,41.53 v1(28.07,41.53) 28.96,42.42 42.39,42.42 CN2.12
  Bottom Layer w0.254: OLED.3 19.94,49.66 v1(28.07,41.53)
LCD_SDA: length 33.4
  Top Layer w0.254: CN2.13 40.61,40.64 v1(28.96,40.64) 27.24,40.64 U1.60
  Bottom Layer w0.254: OLED.4 22.48,48.77 28.96,42.29 v1(28.96,40.64)
NRST: length 20
  Top Layer w0.254: U1.38 26.42,26.17 26.42,22.61 v1(27.69,21.34) ; SW1.1 31.81,11.93 R1.1 30.35,11.93 v1(30.35,14.01)
  Bottom Layer w0.254: v1(27.69,21.34) 30.35,18.67 30.35,14.1
PA0: length 30.3
  Top Layer w0.254: U1.33 23.88,25.18 23.88,20.07 22.73,18.92 v1(22.73,17.2) 22.73,15.43 R24.1 ; v1(25.91,17.14) 39.97,17.14 CN2.31
  Bottom Layer w0.254: v1(22.73,17.2) 25.85,17.2 v1(25.91,17.14)
PA1: length 32.7
  Top Layer w0.254: 24.38,19.81 24.38,25.38 U1.34 ; 24.38,19.81 24.38,15.58 R23.1 ; 24.38,19.81 26.29,17.91 38.48,17.91 40.13,19.56 42.39,19.56 43.66,20.83
PA2: length 25
  Top Layer w0.254: 24.38,30.99 v1(24.43,30.99) U1.42 27.61,27.81 27.61,23.95 30.35,21.21 35.94,21.21 40.64,25.91 41.12,25.91
PA3: length 6.8
  Top Layer w0.254: 30.52,24.24 28.94,25.81 28.94,25.9 28.19,26.64 28.19,27.93 U1.43
PA4: length 7
  Top Layer w0.254: C7.1 30.96,27.7 30.75,27.7 30,28.45 28.38,28.45 27.02,29.81
PA5: length 8.9
  Top Layer w0.254: 27.37,30.16 28.58,28.96 31.88,28.96 32.51,28.32 33.59,28.32 ; 35.19,27.32 35.19,27.51 33.99,28.72
PA6: length 10.8
  Top Layer w0.254: 34.72,31.86 32.49,31.86 30.1,29.46 28.78,29.46 27.73,30.52 ; 34.72,31.86 35.95,33.09 35.95,33.13 ; 34.72,31.86 34.34,31.48 ; 34.72,31.86 34.81,31.86
PA7: length 21.1
  Top Layer w0.254: CN2.22 42.39,29.72 40.39,29.72 39.88,30.23 39.88,33.4 37.21,36.07 33.27,36.07 32,34.8 29.18,34.8 U1.49
PA8: length 16.2
  Top Layer w0.254: CN2.17 40.26,36.07 38.23,38.1 28.95,38.1 U1.54
PA9: length 19.4
  Top Layer w0.254: CN2.16 43.56,38.61 42.29,37.34 40.13,37.34 38.86,38.61 28.75,38.61 U1.55
PA10: length 26.6
  Top Layer w0.254: v1(19.18,18.41) v1(21.84,18.41) ; v1(25.02,34.8) 25.02,35.59 25.96,36.53
  Bottom Layer w0.254: v1(25.02,34.8) 26.16,33.65 26.16,20.45 24.13,18.41 v1(21.84,18.41) ; U2.7 17.52,18.41 v1(19.18,18.41)
PA11: length 26.6
  Top Layer w0.254: v1(21.08,19.05) 19.43,19.05 v1(19.11,19.37) ; U1.57 24.26,35.53 v1(24.26,34.04)
  Bottom Layer w0.254: v1(19.11,19.37) 18.67,19.81 U2.6 ; v1(24.26,34.04) 25.65,32.64 25.65,20.7 24,19.05 v1(21.08,19.05)
PA12: length 20.7
  Top Layer w0.254: CN1.9 3.91,47.5 9.33,47.5 U1.5
PA13: length 16.9
  Top Layer w0.254: U1.6 9.9,46.23 CN1.10
PA14: length 19.3
  Top Layer w0.254: U1.7 10.46,44.96 3.91,44.96 CN1.11
PA15: length 15.5
  Top Layer w0.254: U1.8 11.02,43.69 CN1.12
PA16: length 17.8
  Top Layer w0.254: CN1.13 3.91,42.42 11.58,42.42 17.47,36.53
PA17: length 14
  Top Layer w0.254: CN1.14 5.68,40.64 12.66,40.64 U1.10
PA18: length 16.3
  Top Layer w0.254: U1.11 12.71,39.88 3.91,39.88 CN1.15
PA19: length 38.1
  Top Layer w0.254: CN1.16 v1(8.25,38.61) 13.27,38.61 16.41,35.47
  Bottom Layer w0.254: 14.21,61.68 8.25,55.73 v1(8.25,38.61)
PA20: length 41.5
  Top Layer w0.254: CN1.17 3.91,37.34 v1(11.18,37.34) 13.84,37.34 16.06,35.11
  Bottom Layer w0.254: 16.75,61.68 11.18,56.11 v1(11.18,37.34)
PA21: length 17.9
  Top Layer w0.254: U1.17 13.73,29.95 v1(12.75,29.95) 10.45,32.26 4.32,32.26 3.05,30.99 CN1.21
  Bottom Layer w0.254: 13.73,26.84 13.73,28.18 12.75,29.16 v1(12.75,29.95)
PA22: length 11.6
  Top Layer w0.254: U1.18 13.69,29.21 10.67,29.21 8.89,30.99 CN1.22
PA23: length 14.6
  Top Layer w0.254: 17.47,28.75 14.74,26.02 v1(14.74,25.9) 12.21,23.37 CN1.28
PA24: length 18.6
  Top Layer w0.254: 2.64,20.83 3.91,22.1 12.06,22.1 15.62,25.65 15.62,26.19 U1.25
PA25: length 16.3
  Top Layer w0.254: U1.26 16.13,25.99 16.13,25.4 11.56,20.83 5.18,20.83
PA26: length 19.4
  Top Layer w0.254: U1.30 18.16,25.19 18.16,24.38 9.53,15.75 CN1.34
PA27: length 23.2
  Top Layer w0.254: CN1.35 3.91,14.48 9.02,14.48 18.67,24.13 18.67,24.99 U1.31
PA28: length 24.7
  Top Layer w0.254: 41.12,20.83 40.39,20.83 38.1,18.54 26.67,18.54 24.89,20.32 24.89,25.57 U1.35
PA29: length 27.5
  Top Layer w0.254: CN2.28 42.39,22.1 40.64,22.1 37.72,19.18 26.8,19.18 25.4,20.57 25.4,25.77 U1.36
PA30: length 24.2
  Top Layer w0.254: CN2.27 40.77,23.37 37.08,19.68 27.18,19.68 25.91,20.95 25.91,25.97 U1.37
PA31: length 25.7
  Top Layer w0.254: 43.66,25.91 42.39,24.64 40.39,24.64 36.32,20.57 29.34,20.57 26.92,22.99 26.92,26.37 U1.39
PB0: length 24.7
  Top Layer w0.254: U1.47 28.98,29.97 29.84,29.97 34.92,35.05 36.96,35.05 38.99,33.02 38.99,28.19 40,27.18 42.39,27.18 CN2.24
PB1: length 20.1
  Top Layer w0.254: U1.48 29.18,30.48 29.72,30.48 34.8,35.56 37.08,35.56 39.5,33.15 39.5,29.59 40.64,28.45 CN2.23
PB2: length 45.4
  Top Layer w0.254: v1(32.13,36.19) 31.24,35.31 28.98,35.31 U1.50
  Bottom Layer w0.254: CN2.21 41.12,31.27 36.19,36.19 v1(32.13,36.19) 36.7,40.77 36.7,56.77 31.88,61.59
PB3: length 53
  Top Layer w0.254: v1(30.86,36.19) 30.48,35.81 28.78,35.81 27.73,34.76
  Bottom Layer w0.254: CN2.20 42.42,32.29 42.42,30.48 41.66,29.72 40.26,29.72 39.37,30.61 39.37,32.26 36.07,35.56 31.5,35.56 v1(30.86,36.19) 35.81,41.15 35.81,55.21 29.34,61.68
PB4: length 16
  Top Layer w0.254: CN2.19 40.77,33.53 37.21,37.08 29.34,37.08 27.37,35.11
PB5: length 19.2
  Top Layer w0.254: CN2.18 42.39,34.8 40.39,34.8 37.59,37.59 29.14,37.59 27.02,35.47
PB6: length 16.9
  Top Layer w0.254: U1.58 27.13,39.12 40.61,39.12 CN2.15
PB7: length 20.2
  Top Layer w0.254: CN2.14 42.39,39.88 27.19,39.88 U1.59
PB12: length 20.8
  Top Layer w0.254: U1.64 30,46.23 CN2.9
PB13: length 23.7
  Top Layer w0.254: U1.1 7.08,52.58 3.91,52.58 CN1.5
PB15: length 22.2
  Top Layer w0.254: U1.3 8.21,50.04 3.91,50.04 2.64,48.77
PB16: length 20.8
  Top Layer w0.254: v1(21.34,37.62) 19.92,37.62 U1.4 8.77,48.77 5.18,48.77
PB17: length 11.3
  Top Layer w0.254: 15.71,34.76 14.14,36.32 5.43,36.32 CN1.18
PB18: length 14
  Top Layer w0.254: CN1.19 3.91,34.8 9.4,34.8 10.16,35.56 14.2,35.56 U1.15
PB19: length 10.9
  Top Layer w0.254: U1.16 14,35.05 10.41,35.05 8.89,33.53 CN1.20
PB20: length 14.8
  Top Layer w0.254: CN1.23 3.91,29.72 8.89,29.72 9.91,28.7 13.89,28.7 15.71,30.52
PB21: length 26.9
  Top Layer w0.254: v1(14.86,18.29) 14.81,18.24 SW6.2 ; CN1.24 5.43,28.19 8.93,28.19 v1(8.98,28.15) 9.02,28.19 14.09,28.19 16.06,30.16
  Bottom Layer w0.254: v1(14.86,18.29) 14.86,22.27 v1(8.98,28.15)
PB22: length 26.2
  Top Layer w0.254: v1(18.41,30.41) 18.34,30.49 17.09,30.49 13.78,27.18 3.91,27.18 2.64,25.91
  Bottom Layer w0.254: 20.32,22.73 20.32,28.51 v1(18.41,30.41)
  vias: v1(20.38,22.61)
PB23: length 13.2
  Top Layer w0.254: U1.22 13.09,25.78 5.3,25.78 5.18,25.91
PB24: length 16.9
  Top Layer w0.254: CN1.27 3.91,24.64 12.66,24.64 U1.23
PB25: length 20.2
  Top Layer w0.254: U1.27 16.64,25.79 16.64,25.15 11.05,19.56 3.91,19.56 CN1.31
PB27: length 21.7
  Top Layer w0.254: U1.29 17.65,25.39 17.65,24.64 10.03,17.02 3.91,17.02 CN1.33
USB_D+: length 12.7
  Top Layer w0.254: USB1.8 13.96,8.77 13.71,9.03 12.96,9.03 ; 12.96,9.03 12.96,7.23 ; 12.96,9.03 12.96,9.39 12.83,9.53 v1(12.83,10.67)
  Bottom Layer w0.254: U2.1 12.03,12.36 12.83,11.56 v1(12.83,10.67)
USB_D-: length 16.3
  Top Layer w0.254: 13.46,7.23 13.46,6.47 13.34,6.35 12.57,6.35 12.46,6.47 12.46,9.39 v1(11.56,10.29)
  Bottom Layer w0.254: v1(11.56,10.29) 11.56,11.81 10.29,13.08 10.29,18.03 10.79,18.54 U2.2
VCORE: length 2.9
  Top Layer w0.254: v1(21.73,28.21) 21.73,27.35 U1.32
$1N8212: length 2.7
  Top Layer w0.254: 14.96,7.23 14.96,9.11 R6.1
$1N8214: length 4.4
  Top Layer w0.254: 11.96,7.23 11.96,8.74 11.56,9.14 10.59,9.14 10.41,9.32 10.41,10.09 R8.1
$1N9211: length 2
  Top Layer w0.254: LED3.2 18.01,11.37 R4.2
$1N21299: length 2.3
  Top Layer w0.254: 29.09,6.03 29.09,3.8 C24.2
$1N23399: length 5
  Top Layer w0.254: R23.2 R24.2 R9.2 R25.2
$1N23715: length 2.1
  Top Layer w0.254: R12.2 21.92,20.73 LED2.1
$1N24179: length 8.5
  Top Layer w0.254: 14.9,57.95 14.9,53.5 OLED.1 14.86,49.89 R26.1
$1N24180: length 8.5
  Top Layer w0.254: 17.27,57.98 17.4,57.85 OLED.2 17.4,49.72 R27.1

## Copper pours and planes (outline as drawn; the poured copper is in the pictures)
GND on Top Layer: -8,71.12 76.84,71.12 76.84,-12.7 -8,-12.7
GND on Bottom Layer: -22.73,77.85 99.19,77.85 99.19,-29.08 -22.73,-29.08

Small or netless copper shapes (teardrops, artwork), in the pictures only: 249 on Top Layer, 56 on Bottom Layer

## Text on the board
Bottom Silkscreen Layer: 5V | GND | 3V3 | PA29 | PB13 | PA12 | PB15 | PA14 | PA16 | PB18 | PA21 | PB21 | PB22 | PB24 | PB26 | PA20 | PA25 | PA26 | PA27 | PA19 | PB17 | PB19 | PA22 | PB14 | PB16 | PA13 | PA15 | PA23 | PB23 | PA2 | PA30 | PA28 | PB12 | PA0 | PB4 | PB2 | PB1 | PB10 | PB6 | PB8 | PA8 | PA1 | PB11 | PB3 | PB9 | PB7 | PA9 | PA7 | PB0 | PA31 | PB5 | PA24 | PB25 | PB27 | PB20
Top Silkscreen Layer: GND | 3V3 | SWDIO | SCLK | SCL | SDA | RES | DC | RX | CS | TX | BLK | PB13 | PB15 | PA12 | PA14 | PA16 | PA18 | PA20 | PB18 | PA21 | PB20 | PB22 | PB24 | PA24 | PB25 | PB27 | PA19 | PB17 | PB19 | PA22 | PB21 | PB23 | PA23 | PA25 | PB26 | PA26 | PB14 | PB16 | PA13 | PA15 | PB12 | PB10 | PB6 | PB8 | PA8 | PA30 | PA28 | PB11 | PB9 | PB7 | PA9 | PA0 | PB5 | PB4 | PB2 | PA2 | PB1 | PA27 | PB3 | PA7 | PB0 | PA31 | PA1 | 5V | RST | PA29
